# Altium schematic sheet SIM.A7682.CONECTER.SchDoc: HMS.SIMA7682.CONECTER
size A4
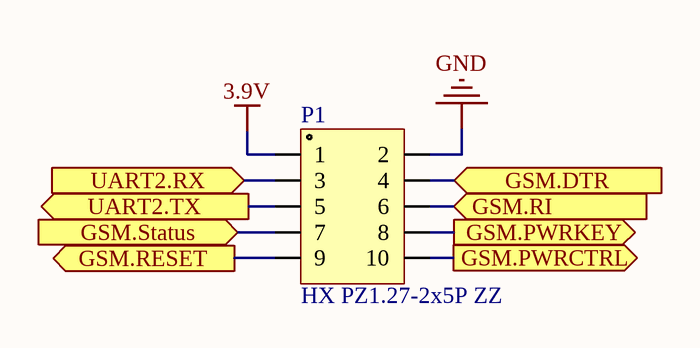
[diagram p0: SIM.A7682.CONECTER.SchDoc]

## Parts
P1  HX PZ1.27-2x5P ZZ  [HX PZ1.27-2x5P ZZ]

## Ports
GSM.DTR (in), GSM.PWRCTRL (out), GSM.PWRKEY (out), GSM.RESET (out), GSM.RI (in), GSM.Status (in), UART2.RX (in), UART2.TX (out)

## Nets
3.9V: P1.1
GND: P1.2
GSM.DTR: P1.4 ; port GSM.DTR
GSM.PWRCTRL: P1.10 ; port GSM.PWRCTRL
GSM.PWRKEY: P1.8 ; port GSM.PWRKEY
GSM.RESET: P1.9 ; port GSM.RESET
GSM.RI: P1.6 ; port GSM.RI
GSM.Status: P1.7 ; port GSM.Status
UART2.RX: P1.3 ; port UART2.RX
UART2.TX: P1.5 ; port UART2.TX

## Notes on the sheet
- Title
- Size:
- Date:
- A4
- Number:
- Time:
- Revision:
- Sheet
- of
- File:

## Library data of the parts
P1 = HX PZ1.27-2x5P ZZ: Pin1.27mmpitch 2*5PStraight Pin Dual row vertical DIP Mating female header：HX PM1.27-2x5Pseries Black6TMaterial...; Manufacturer: hanxia; Connector Type: Forked, Receptacle; Current Rating: 2A; Dielectric Material: Polyamide; Insulation Resistance: 5GΩ; Number of Contacts: 5; Number of Positions: 10; Pitch: 1.27; Supplier 1: Mouser; Manufacturer Part Number: HX PZ1.27-2x5P ZZ; RoHS: Compliant; Category: Card Edge Connectors; Stock 1: 1610; Pricing 1: 1=2, 10=1.79, 50=1.79, 100=1.7, 1000=1.22, 10000=1.18 (USD); China RoHS: Compliant; Color: Black; Contact Gender: Female; Contact Plating: Tin; Depth: 1.27; Export Control Classification Number (ECCN) Code: EAR99; Gender: Female; Height: 8.26mm; Housing Color: Black; Harmonized Tariff Schedule (HTS) Code: 8536.69.40.40; Insulation Color: Black; Introduction Date: 2007-03-15; Lead Free: Lead Free; Lifecycle Status: Production; Max Current Rating: 2A; Max Operating Temperature: 105°C; Min Operating Temperature: -40°C; Mount: Through Hole; Number of Rows: 2; Orientation: Straight; Packaging: Bulk; REACH SVHC: Unaffected; Terminal Pitch: 1.27mm; Termination: Solder; ComponentLink1URL: https://datasheet.octopart.com:443/929974-01-10-RK-3M-datasheet-24569739.pdf?src-supplier=IHS; ComponentLink1Description: https://datasheet.octopart.com:443/929974-01-10-RK-3M-datasheet-24569739.pdf?src-supplier=IHS; ComponentLink2URL: https://datasheet.octopart.com:443/80000909525-3M-datasheet-5391050.pdf?src-supplier=Arrow+Electronics; ComponentLink2Description: https://datasheet.octopart.com:443/80000909525-3M-datasheet-5391050.pdf?src-supplier=Arrow+Electronics; ComponentLink3URL: http://sigma.octopart.com:80/conflict_mineral_statement/3M-company-24.pdf?src-supplier=Compliance+Statements; ComponentLink3Description: http://sigma.octopart.com:80/conflict_mineral_statement/3M-company-24.pdf?src-supplier=Compliance+Statements; MPN: HX PZ1.27-2x5P ZZ; ComponentLink4Description: New link; ComponentLink4URL: *; Value: HX PZ1.27-2x5P ZZ